# Altium schematic sheet Mixer.SchDoc
size B; SheetNumber: 3; SheetTotal: 9
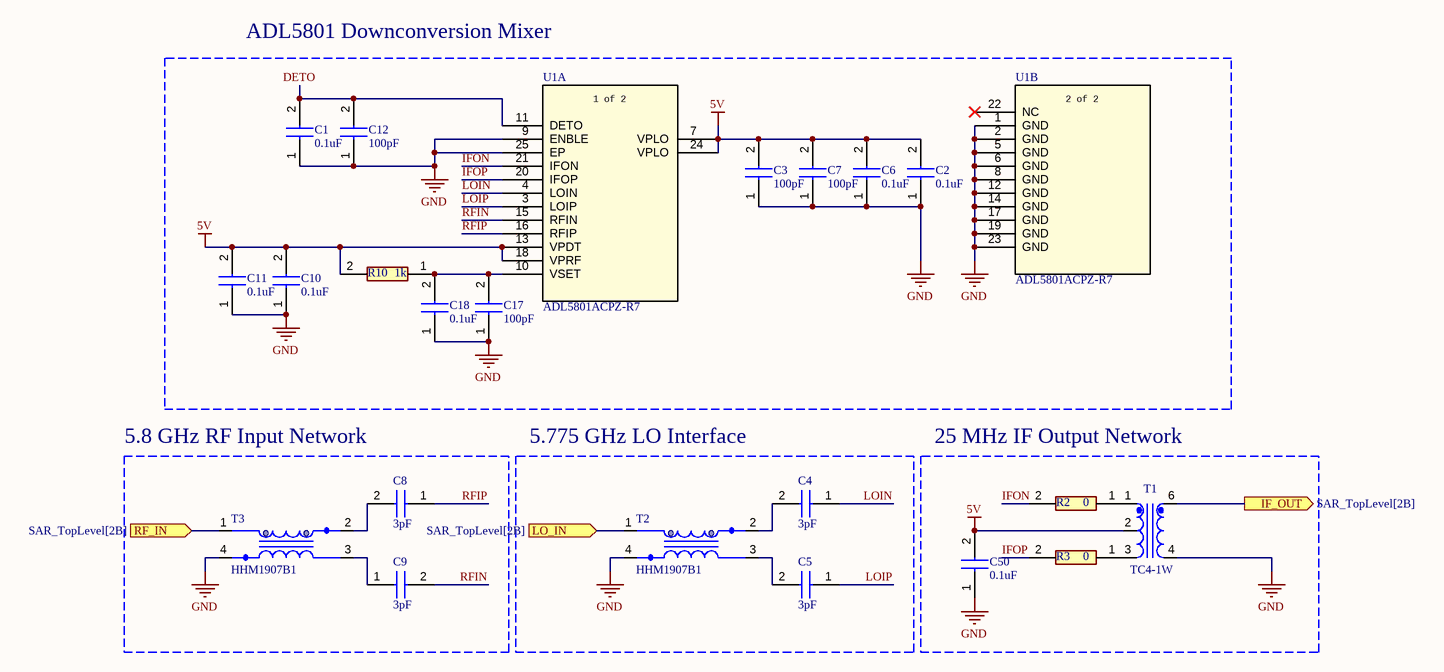
[diagram p0: Mixer.SchDoc]

## Parts
C1  0.1uF  [C0603]
C2  0.1uF  [C0402C104J4RACTU]
C3  100pF  [CAPC1005X70N]
C4  3pF  [CAPC1005X55N]
C5  3pF  [CAPC1005X55N]
C6  0.1uF  [C0402C104J4RACTU]
C7  100pF  [CAPC1005X70N]
C8  3pF  [CAPC1005X55N]
C9  3pF  [CAPC1005X55N]
C10  0.1uF  [C0402C104J4RACTU]
C11  0.1uF  [C0402C104J4RACTU]
C12  100pF  [CAPC1005X70N]
C17  100pF  [CAPC1005X70N]
C18  0.1uF  [C0603]
C50  0.1uF  [C0402C104J4RACTU]
R2  0  [RESC1005X40N]
R3  0  [RESC1005X40N]
R10  1k  [RESC1005X40N]
T1  TC4-1W  [AT224_MNC]
T2  HHM1907B1  [HHM1907B1]
T3  HHM1907B1  [HHM1907B1]
U1  ADL5801ACPZ-R7  [CP_24_3_ADI]  (parts A,B of 2)

## Blocks framed on the sheet
ADL5801 Downconversion Mixer: C1-C3 C6 C7 C10-C12 C17 C18 R10 U1
5.8 GHz RF Input Network: C8 C9 T3
5.775 GHz LO Interface: C4 C5 T2
25 MHz IF Output Network: C50 R2 R3 T1

## Ports
IF_OUT (out, see SAR_TopLevel[2B]), LO_IN (in, see SAR_TopLevel[2B]), RF_IN (in, see SAR_TopLevel[2B])

## Nets
5V: C2.2 C3.2 C6.2 C7.2 C10.2 C11.2 C50.2 R10.2 T1.2(PRICT) U1.7(VPLO) U1.13(VPDT) U1.18(VPRF) U1.24(VPLO)
GND: C1.1 C2.1 C3.1 C6.1 C7.1 C10.1 C11.1 C12.1 C17.1 C18.1 C50.1 T1.4(SEC) T2.4(GND) T3.4(GND) U1.1(GND) U1.2(GND) U1.5(GND) U1.6(GND) U1.8(GND) U1.9(ENBLE) U1.12(GND) U1.14(GND) U1.17(GND) U1.19(GND) U1.23(GND) U1.25(EP)
DETO: C1.2 C12.2 U1.11(DETO)
IF_OUT: T1.6(SECDOT) ; port IF_OUT
IFON: R2.2 U1.21(IFON)
IFOP: R3.2 U1.20(IFOP)
LO_IN: T2.1(UNBAL) ; port LO_IN
LOIN: C4.1 U1.4(LOIN)
LOIP: C5.1 U1.3(LOIP)
RF_IN: T3.1(UNBAL) ; port RF_IN
RFIN: C9.2 U1.15(RFIN)
RFIP: C8.1 U1.16(RFIP)
NetC4_2: C4.2 T2.2(BALANCED_1)
NetC5_2: C5.2 T2.3(BALANCED_2)
NetC8_2: C8.2 T3.2(BALANCED_1)
NetC9_1: C9.1 T3.3(BALANCED_2)
NetC17_2: C17.2 C18.2 R10.1 U1.10(VSET)
NetR2_1: R2.1 T1.1(PRIDOT)
NetR3_1: R3.1 T1.3(PRI)

Not connected (* = marked no-connect by the designer): U1 22(NC)*

## Notes on the sheet
- DWG. NO.
- REV.
- SHT.
- THIS DOCUMENT AND THE DATA DISCLOSED HEREIN OR HEREWITH IS THE PROPERTY OF ALTIUM LIMITED AND MAY BE FREELY DISTRIBUTED IN WHOLE. NO RIGHTS ARE RESERVED OR EXPRESS OR IMPLIED WARANTEE GIVEN.
- REVISION
- DESCRIPTION
- DATE
- APPROVED
- ENG:
- APPROVALS
- PROJECT
- DSN:
- CHK:
- REFERENCE DOCUMENTS
- PROJECT REVISION:
- TITLE
- DOCUMENT REVISION:
- DESIGN ITEM:
- BOM:
- FAB DWG:
- PCB DWG:
- ASSY DWG:
- SCALE:
- SIZE
- B
- CAGE CODE
- FILE NAME
- DWG NO.
- SHEET
- OF
- REV
- (in symbol ADL5801ACPZ-R7, part A) 1 of 2
- (in symbol ADL5801ACPZ-R7, part B) 2 of 2

## Library data of the parts
C1 C18 = 0.1uF 0603 Capacitor: C0603C104K4RACAUTO; Manufacturer_Name: Yageo Group; Datasheet Link: https://content.kemet.com/datasheets/KEM_C1023_X7R_AUTO_SMD.pdf; Height: 0.87mm; Manufacturer_Part_Number: C0603C104K4RACAUTO; Mouser Part Number: 80-C0603C104K4RAUTO; Mouser Price/Stock: https://www.mouser.co.uk/ProductDetail/KEMET/C0603C104K4RACAUTO?qs=OHu5RF0w3Qq6uXbO9XN%2FyA%3D%3D; Arrow Part Number: C0603C104K4RACAUTO; Arrow Price/Stock: https://www.arrow.com/en/products/c0603c104k4racauto/kemet-corporation?region=nac
C2 C6 C10 C11 = 0.1uF Capacitor 0402: C0402C104K4RACTU; Manufacturer_Name: Yageo Group; Datasheet Link: https://content.kemet.com/datasheets/KEM_C1002_X7R_SMD.pdf; Height: 0.55mm; Manufacturer_Part_Number: C0402C104K4RACTU; Mouser Part Number: 80-C0402C104K4R; Mouser Price/Stock: https://www.mouser.co.uk/ProductDetail/KEMET/C0402C104K4RACTU?qs=DBJr%252BvBUjU54jK7d4uAeew%3D%3D; Arrow Part Number: C0402C104K4RACTU; Arrow Price/Stock: https://www.arrow.com/en/products/c0402c104k4ractu/kemet-corporation.html?utm_currency=USD&region=nac
C3 C7 C12 C17 = 100pF Capacitor 0402: GRM1555C1H101JA01J; Manufacturer_Name: Murata Electronics; Datasheet Link: https://search.murata.co.jp/Ceramy/image/img/A01X/G101/ENG/GRM1555C1H101JA01-01A.pdf; Height: 0.7mm; Manufacturer_Part_Number: GRM1555C1H101JA01J; Mouser Part Number: 81-GRM1555C1H101JA1J; Mouser Price/Stock: https://www.mouser.co.uk/ProductDetail/Murata-Electronics/GRM1555C1H101JA01J?qs=ouTquLLW2S6yVyqkMCWoRg%3D%3D; Arrow Part Number: GRM1555C1H101JA01J; Arrow Price/Stock: https://www.arrow.com/en/products/grm1555c1h101ja01j/murata-manufacturing?utm_currency=USD&region=nac
C4 C5 C8 C9 = 3pF 0402 Capacitor: GJM1555C1H3R0BB01D; Manufacturer_Name: Murata Electronics; Datasheet Link: https://search.murata.co.jp/Ceramy/image/img/A01X/G101/ENG/GJM1555C1H3R0BB01-01A.pdf; Height: 0.55mm; Manufacturer_Part_Number: GJM1555C1H3R0BB01D; Mouser Part Number: 81-GJM1555C1H3R0BB01; Mouser Price/Stock: https://www.mouser.co.uk/ProductDetail/Murata-Electronics/GJM1555C1H3R0BB01D?qs=fOe5G3t%252BQHoZjxUrLCJNQQ%3D%3D; Arrow Part Number: GJM1555C1H3R0BB01D; Arrow Price/Stock: https://www.arrow.com/en/products/gjm1555c1h3r0bb01d/murata-manufacturing
C50 = 0.1uF 0402 Capacitor: C0402C104K4RACTU; Manufacturer_Name: Yageo Group; Datasheet Link: https://content.kemet.com/datasheets/KEM_C1002_X7R_SMD.pdf; Height: 0.55mm; Manufacturer_Part_Number: C0402C104K4RACTU; Mouser Part Number: 80-C0402C104K4R; Mouser Price/Stock: https://www.mouser.co.uk/ProductDetail/KEMET/C0402C104K4RACTU?qs=DBJr%252BvBUjU54jK7d4uAeew%3D%3D; Arrow Part Number: C0402C104K4RACTU; Arrow Price/Stock: https://www.arrow.com/en/products/c0402c104k4ractu/kemet-corporation.html?utm_currency=USD&region=nac
R2 R3 = 0 Ohm 0402 Resistor: RC0402JR-070RL; Manufacturer_Name: Yageo Group; Datasheet Link: https://www.yageo.com/upload/media/product/products/datasheet/rchip/PYu-RC_Group_51_RoHS_L_12.pdf; Height: 0.4mm; Manufacturer_Part_Number: RC0402JR-070RL; Mouser Part Number: 603-RC0402JR-070RL; Mouser Price/Stock: https://www.mouser.co.uk/ProductDetail/YAGEO/RC0402JR-070RL?qs=5Bml4Cp94iv7ykKkzPrwpQ%3D%3D; Arrow Part Number: RC0402JR-070RL; Arrow Price/Stock: https://www.arrow.com/en/products/rc0402jr-070rl/yageo.html?utm_currency=USD&region=asia
R10 = 1k 0402 Resistor: RC0402FR-071KL; Manufacturer_Name: Yageo Group; Datasheet Link: https://yageogroup.com/products/Resistors/part/RC0402FR-071KL; Height: 0.4mm; Manufacturer_Part_Number: RC0402FR-071KL; Mouser Part Number: 603-RC0402FR-071KL; Mouser Price/Stock: https://www.mouser.co.uk/ProductDetail/YAGEO/RC0402FR-071KL?qs=V1yeUXFNrknDEmWLmm5v6g%3D%3D; Arrow Part Number: RC0402FR-071KL; Arrow Price/Stock: https://www.arrow.com/en/products/rc0402fr-071kl/yageo.html?utm_currency=USD&region=asia
T1 = TC4-1W+ 1:4 Transformer: TC4-1W+; Manufacturer_Name: Mini Circuits; Copyright: Copyright (C) 2026 Ultra Librarian. All rights reserved.; Manufacturer_Part_Number: TC4-1W; RefDes: RefDes; Type: Type
T2 T3 = 5.8 GHz Balun Transformer: MANF: Mini-Circuit; PARAM: 10~6000MHz; DESC: DESCRIPTION; MANF_P#: TCM1-63AX+; PARAM2: 0.2W, 30mA, -40~85oC; ASSEMBLY: ASSEMBLY; PRICE: PRICE; VALUE: HHM1907B1
U1 = ADL5801ACPZ-R7: High IP3, 10 MHz TO 6 GHz, Active Mixer; Manufacturer_Name: Analog Devices Inc; Copyright: Copyright (C) 2026 Ultra Librarian. All rights reserved.; Manufacturer_Part_Number: ADL5801ACPZ-R7; Datasheet: https://www.analog.com/media/en/technical-documentation/data-sheets/ADL5801.pdf; RefDes: RefDes; Type: Type